# EAGLE design ballspeed (EAGLE 9.6.1)
REVISION: v1.0; TEAM: RoboCup SSL

## Sheet 1 of 3: 5V Regulator
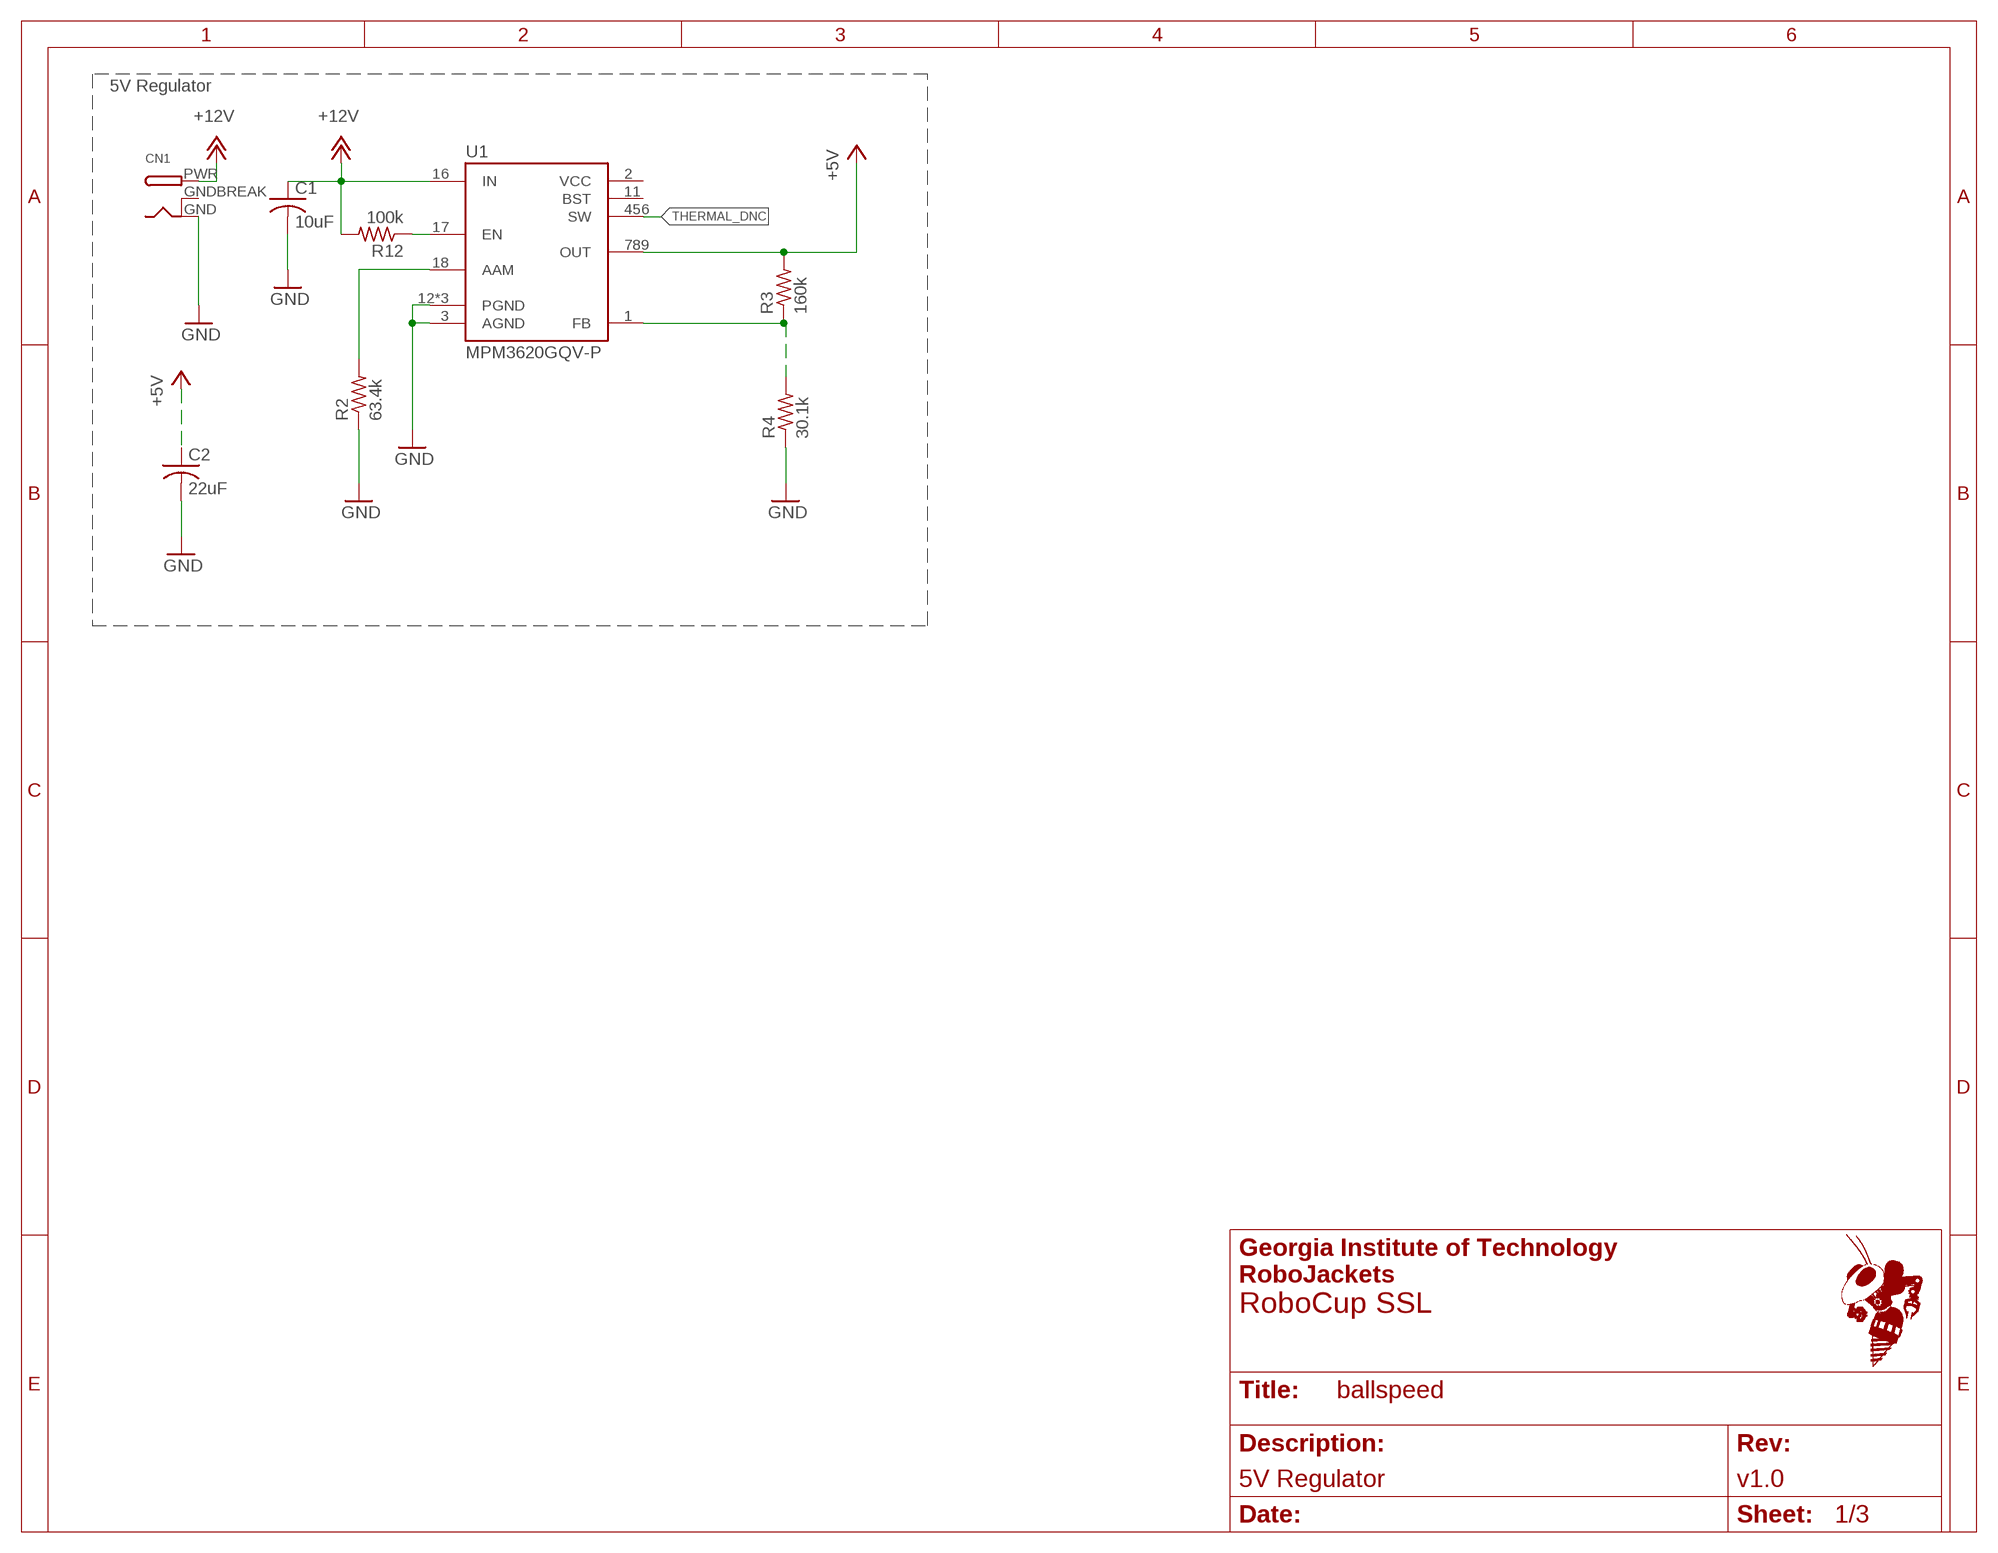
[diagram p0: schematic, sheet 1]
FRAME3 (FRAME_A_L): REVISION: v1.0; SCH_DESC: 5V Regulator; TEAM: RoboCup SSL

### Parts
C1  10uF  C-USC0603  [C0603]
C2  22uF  C-USC0603  [C0603]
CN1  DCBARRELPTH  [DCJACK_2MM_PTH]
R2  63.4k  R0603W  [R0603W]
R3  160k  R0603W  [R0603W]
R4  30.1k  R0603W  [R0603W]
R12  100k  R0603W  [R0603W]
U1  MPM3620GQV-P  [MPM3620GQV-P]

### Nets
+5V: C2.1 R3.2(PIN2) U1.789(OUT) ; also sheet 3
+12V: C1.1 CN1.PWR R12.2(PIN2) U1.16(IN)
GND: C1.2 C2.2 CN1.GND R2.1(PIN1) R4.1(PIN1) U1.3(AGND) U1.12(PGND) U1.13(PGND) U1.14(PGND) ; also sheet 2,3
N$1: R3.1(PIN1) R4.2(PIN2) U1.1(FB)
N$3: R2.2(PIN2) U1.18(AAM)
N$7: R12.1(PIN1) U1.17(EN)
THERMAL_DNC: U1.456(SW)
Unconnected: U1.2(VCC) U1.11(BST)

### Notes on the sheet
- 5V Regulator

## Sheet 2 of 3: ADC
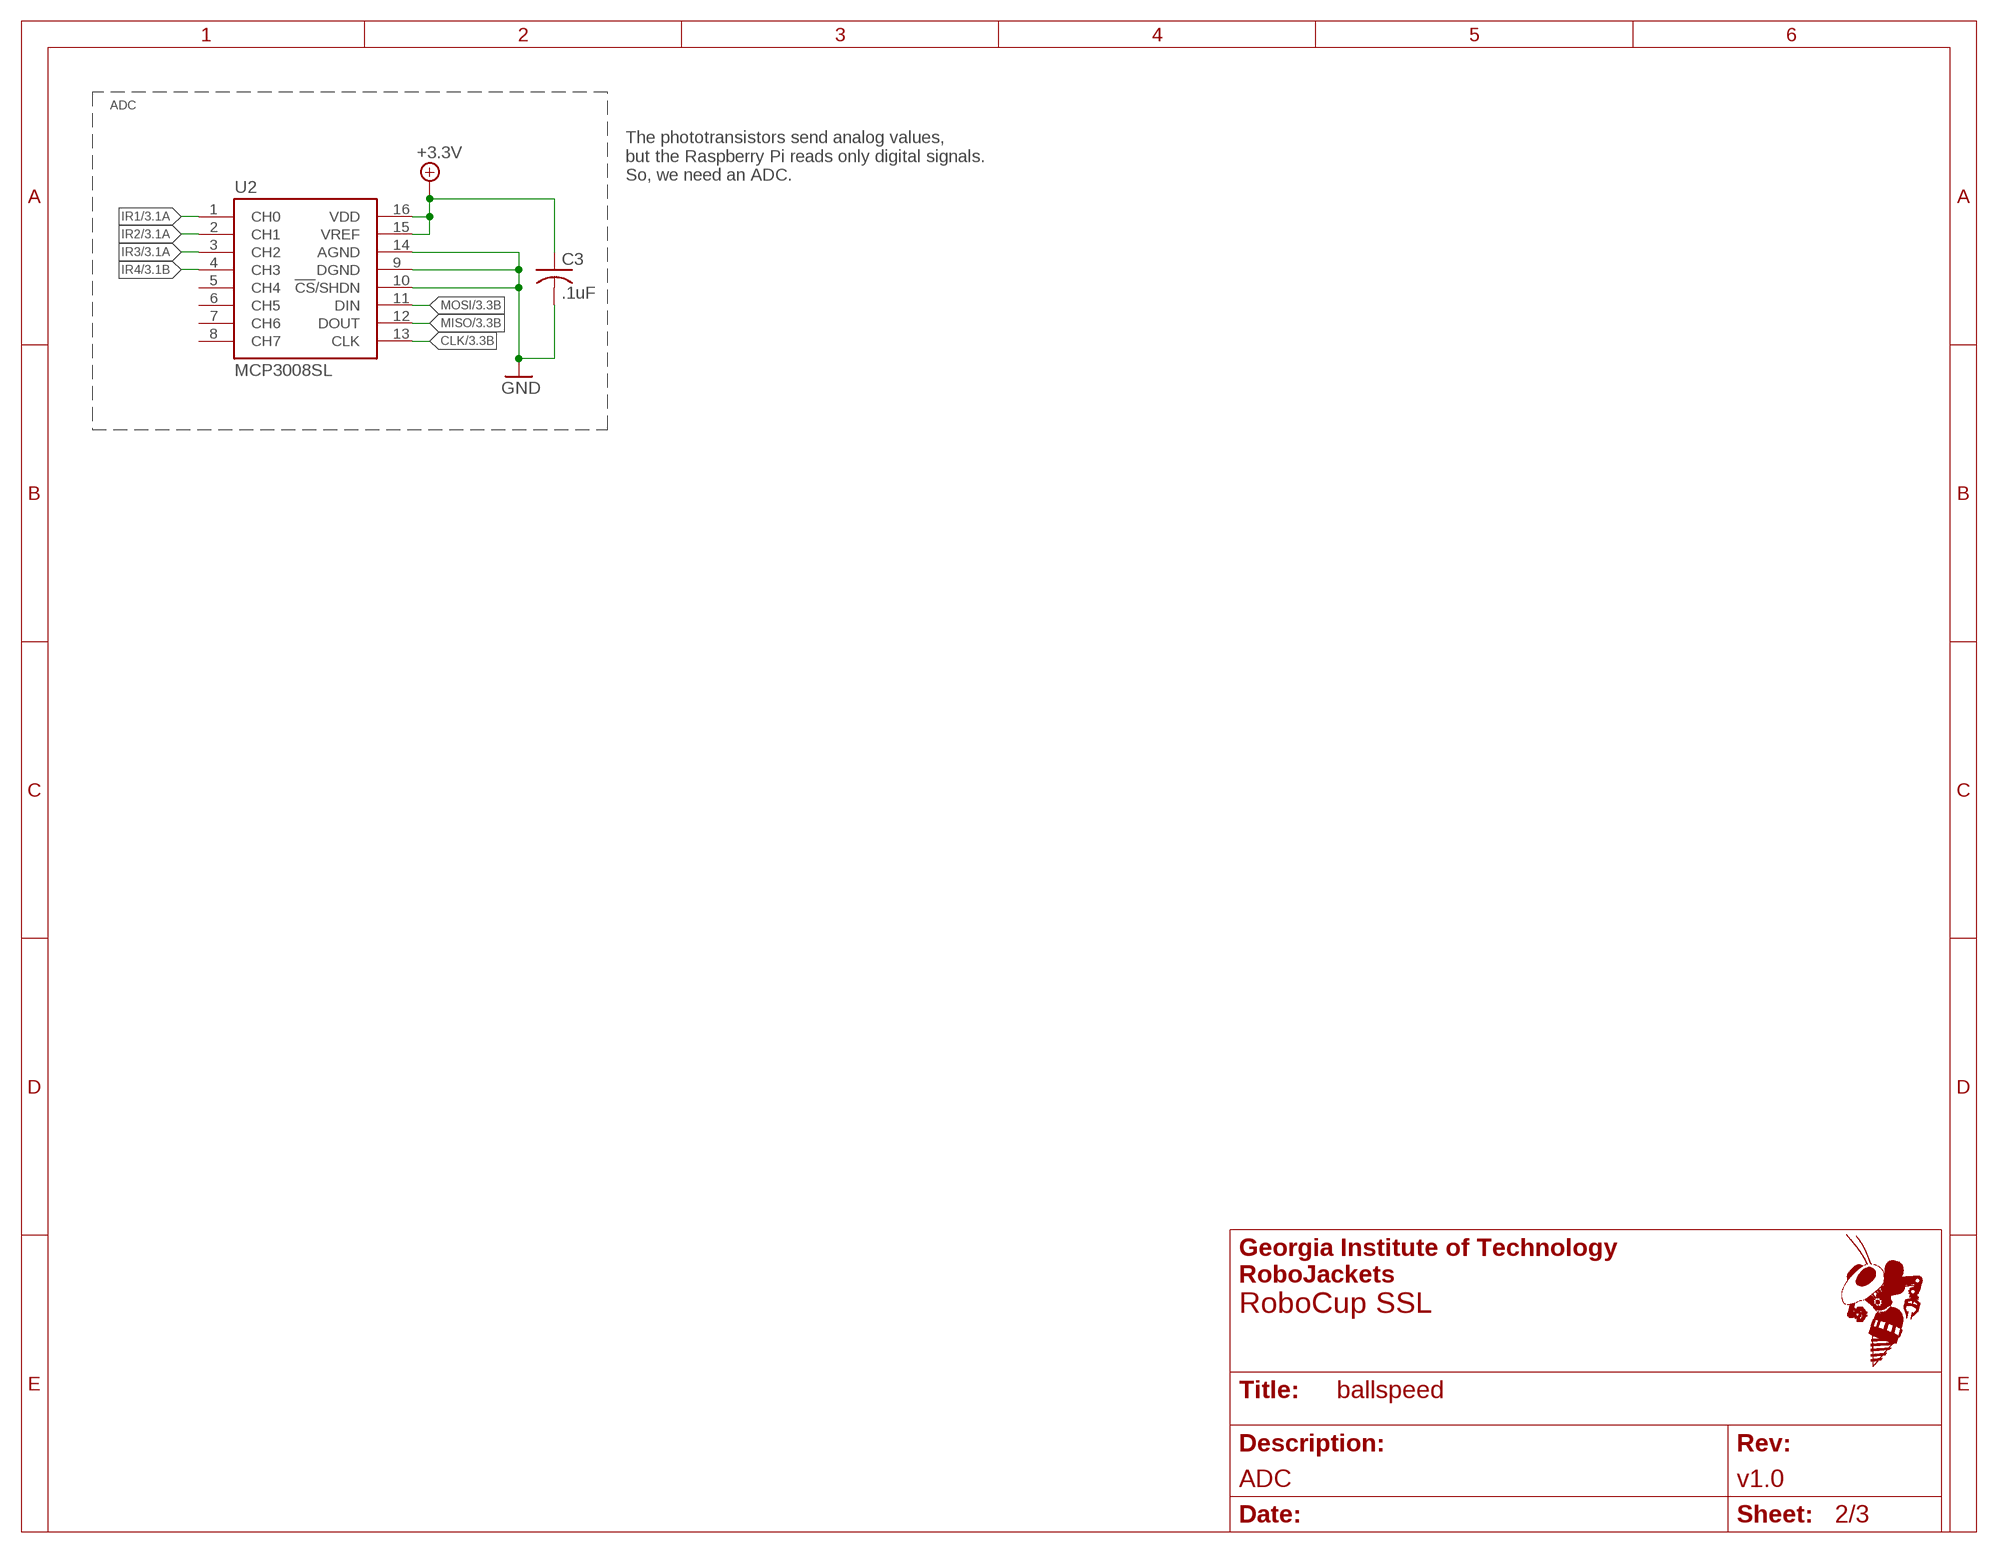
[diagram p1: schematic, sheet 2]
FRAME2 (FRAME_A_L): REVISION: v1.0; SCH_DESC: ADC; TEAM: RoboCup SSL

### Parts
C3  .1uF  C-USC0603  [C0603]
U2  MCP3008SL  [SOIC-16]

### Nets
+3.3V: C3.1 U2.15(VREF) U2.16(VDD) ; also sheet 3
CLK: U2.13(CLK) ; also sheet 3
GND: C3.2 U2.9(DGND) U2.10(!CS!/SHDN) U2.14(AGND) ; also sheet 1,3
IR1: U2.1(CH0) ; also sheet 3
IR2: U2.2(CH1) ; also sheet 3
IR3: U2.3(CH2) ; also sheet 3
IR4: U2.4(CH3) ; also sheet 3
MISO: U2.12(DOUT) ; also sheet 3
MOSI: U2.11(DIN) ; also sheet 3
Unconnected: U2.5(CH4) U2.6(CH5) U2.7(CH6) U2.8(CH7)

### Notes on the sheet
- ADC
- The phototransistors send analog values,
  but the Raspberry Pi reads only digital signals.
  So, we need an ADC.

## Sheet 3 of 3: Connectors
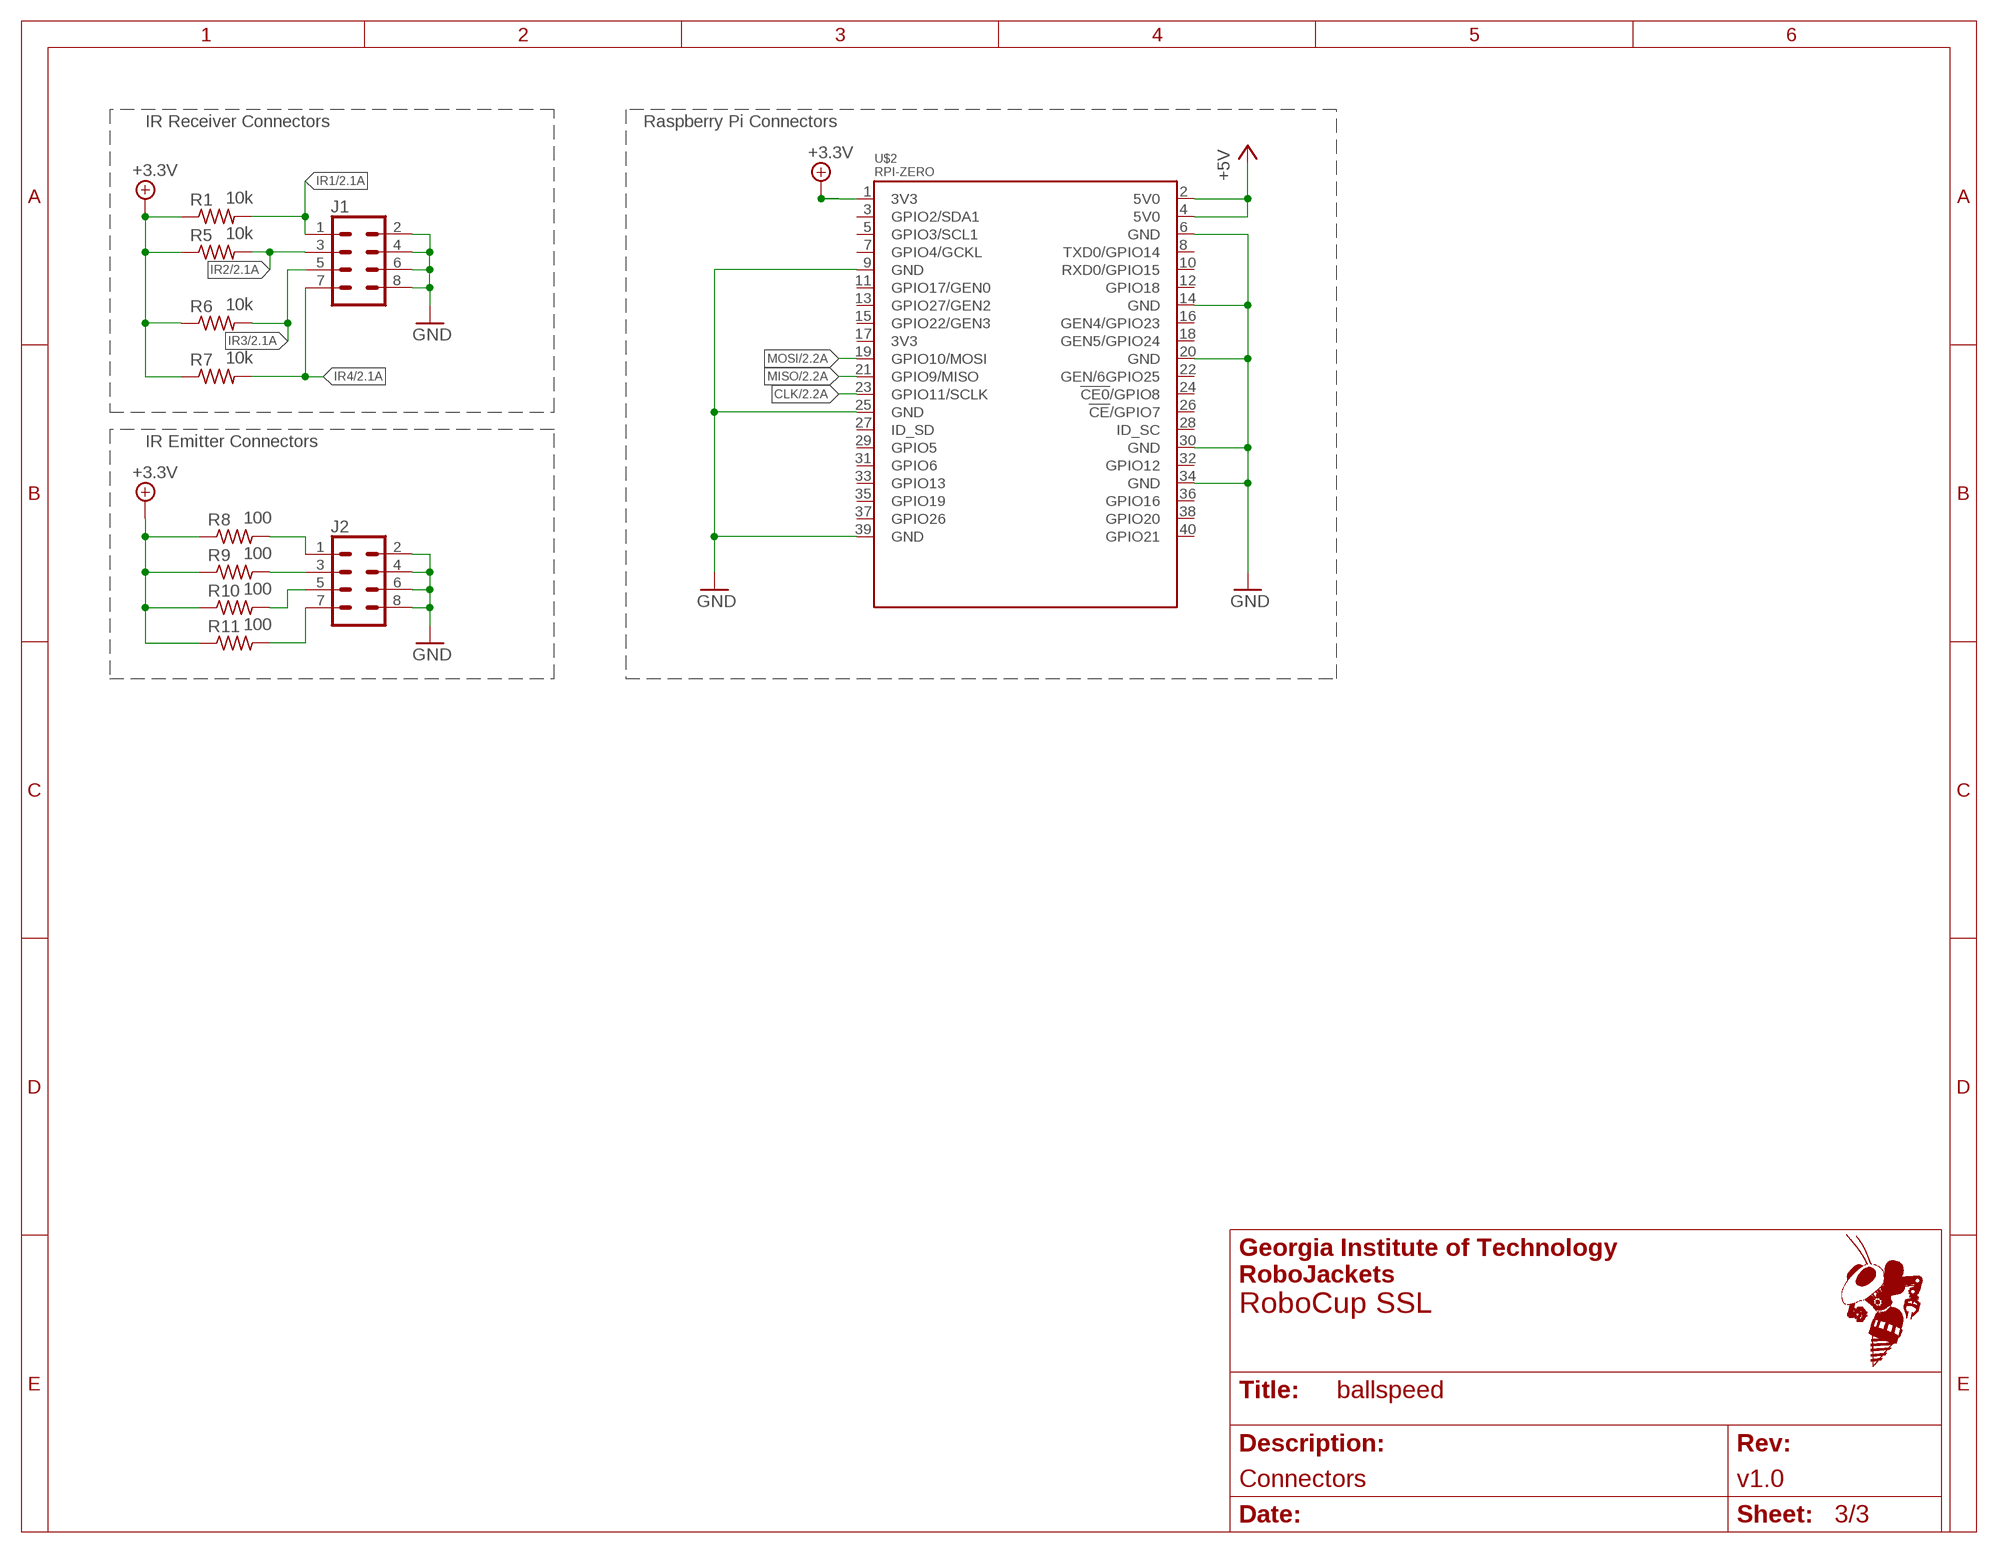
[diagram p2: schematic, sheet 3]
FRAME1 (FRAME_A_L): REVISION: v1.0; SCH_DESC: Connectors; TEAM: RoboCup SSL

### Parts
J1  CONN_04X2  [2X4]
J2  CONN_04X2  [2X4]
R1  10k  R0603W  [R0603W]
R5  10k  R0603W  [R0603W]
R6  10k  R0603W  [R0603W]
R7  10k  R0603W  [R0603W]
R8  100  R0603W  [R0603W]
R9  100  R0603W  [R0603W]
R10  100  R0603W  [R0603W]
R11  100  R0603W  [R0603W]
U$2  RPI-ZERO  [RASPBERRYPI_BASTELSTUBE_V13_RASPI_BOARD_B+_FULL]

### Nets
+3.3V: R1.1(PIN1) R5.1(PIN1) R6.1(PIN1) R7.1(PIN1) R8.1(PIN1) R9.1(PIN1) R10.1(PIN1) R11.1(PIN1) U$2.1(3V3) ; also sheet 2
+5V: U$2.2(5V0) U$2.4(5V0) ; also sheet 1
CLK: U$2.23(GPIO11/SCLK) ; also sheet 2
GND: J1.2 J1.4 J1.6 J1.8 J2.2 J2.4 J2.6 J2.8 U$2.6(GND) U$2.9(GND) U$2.14(GND) U$2.20(GND) U$2.25(GND) U$2.30(GND) U$2.34(GND) U$2.39(GND) ; also sheet 1,2
IR1: J1.1 R1.2(PIN2) ; also sheet 2
IR1-3.3V: J2.1 R8.2(PIN2)
IR2: J1.3 R5.2(PIN2) ; also sheet 2
IR2-3.3V: J2.3 R9.2(PIN2)
IR3: J1.5 R6.2(PIN2) ; also sheet 2
IR3-3.3V: J2.5 R10.2(PIN2)
IR4: J1.7 R7.2(PIN2) ; also sheet 2
IR4-3.3V: J2.7 R11.2(PIN2)
MISO: U$2.21(GPIO9/MISO) ; also sheet 2
MOSI: U$2.19(GPIO10/MOSI) ; also sheet 2
Unconnected: U$2.3(GPIO2/SDA1) U$2.5(GPIO3/SCL1) U$2.7(GPIO4/GCKL) U$2.8(TXD0/GPIO14) U$2.10(RXD0/GPIO15) U$2.11(GPIO17/GEN0) U$2.12(GPIO18) U$2.13(GPIO27/GEN2) U$2.15(GPIO22/GEN3) U$2.16(GEN4/GPIO23) U$2.17(3V3) U$2.18(GEN5/GPIO24) U$2.22(GEN/6GPIO25) U$2.24(!CE0!/GPIO8) U$2.26(!CE!/GPIO7) U$2.27(ID_SD) U$2.28(ID_SC) U$2.29(GPIO5) U$2.31(GPIO6) U$2.32(GPIO12) U$2.33(GPIO13) U$2.35(GPIO19) U$2.36(GPIO16) U$2.37(GPIO26) U$2.38(GPIO20) U$2.40(GPIO21)

### Notes on the sheet
- IR Receiver Connectors | Raspberry Pi Connectors
- IR Emitter Connectors

## Power pins joined to a net without a drawn wire
GNDBREAK: CN1.GNDBREAK

## Library data of the parts
C1-C3 = rcl:C-US: CAPACITOR, American symbol; SPICEPREFIX: C
CN1 = adafruit:DCBARREL: 2.0mm DC Barrel Jack DCJACK_2MM_PTH - Through Hole Jack (4UConnector: 05537)
J1 J2 = SparkFun-Connectors:CONN_04X2: Multi connection point. Often used as Generic Header-pin footprint for 0.1 inch spaced/style header connections On any of the 0.1 inch spaced packages, you can populate with these: Break Away Headers - Straight <https://www.sparkfun.com/products/116> (PRT-00116) Break Away Male Headers - Right Angle <https://www.sparkfun.com/products/553> (PRT-00553) Female Headers <https://www.sparkfun.com/products/115> (PRT-00115) Break Away Headers - Machine Pin <https://www.sparkfun.com/products/117> (PRT-00117) Break Away Female Headers - Swiss Machine Pin <https://www.sparkfun.com/products/743> (PRT-00743)
R1-R12 = RoboJackets-Resistors:R0603W
U1 = RoboJackets-PowerICs:MPM3620GQV-P
U2 = RoboJackets-ICs:MCP3008
U$2 = RPI-Zero:RPI-ZERO

## Board
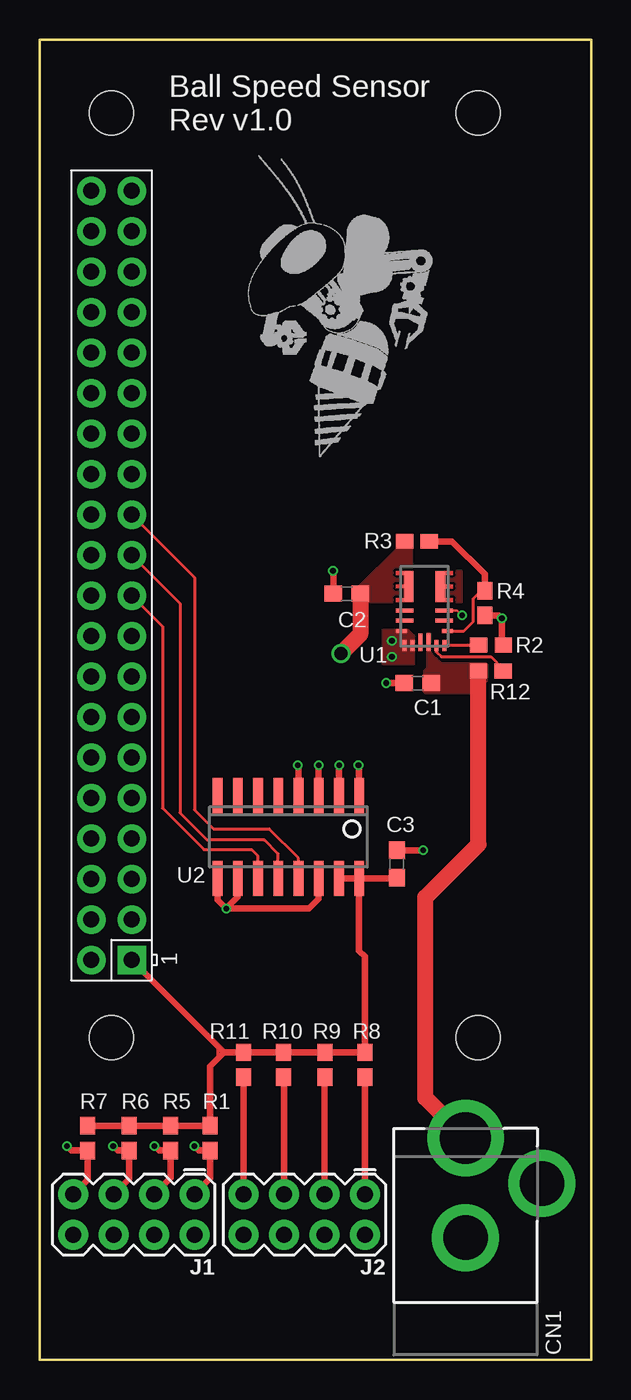
[diagram p3: board, top side]
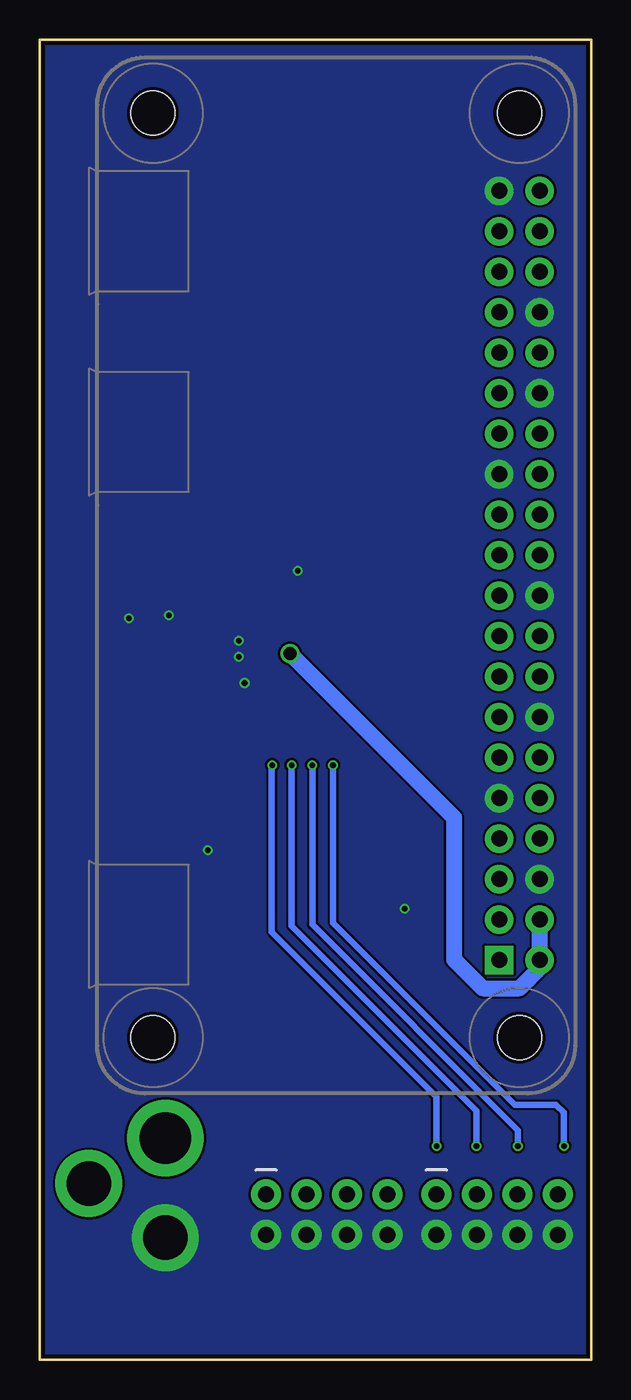
[diagram p4: board, bottom side, seen from below]

Size 34.6 x 82.8 mm. Coordinates in mm from the lower left corner, seen from the top.
Outline: 0,82.8 0,0 34.6,0 34.6,82.8 0,82.8
Copper layers (1*16): Top 0.018mm / dielectric 1.55mm / Bottom 0.018mm
Design rules "eC_2Layer_PClass6_BaseCopperO18_eCDefault": minimum track width 0.15mm, minimum drill 0.35mm, track to track 0.15mm, track to pad 0.15mm, pad to pad 0.15mm, via to via 0.15mm, smd to smd 0mil, copper to edge 0.25mm, drill to drill 0.35mm, minimum pad ring 0.175mm, minimum via ring 0.125mm, stop-mask expansion 0mil, vias tented up to drill 0.45mm, thermal gap 0.2mm

### Footprints (pad centres in the part's own frame; a part is rotated, then mirrored left to right if it is on the bottom)
C0603 = smd 1.1 x 1: 1 -0.85,0; 2 0.85,0
DCJACK_2MM_PTH = drill 2.8: GND 0,7.35; GNDBREAK 4.8,10.75 | drill 3.2: PWR 0,13.6
2X4 = drill 1.016 pad 1.88: 1 -3.81,-1.27; 2 -3.81,1.27; 3 -1.27,-1.27; 4 -1.27,1.27; 5 1.27,-1.27; 6 1.27,1.27; 7 3.81,-1.27; 8 3.81,1.27
R0603W = smd 1.09 x 0.94: 1 -0.775,0; 2 0.775,0
MPM3620GQV-P = smd 0.7 x 0.25: 1 -1.45,1.55; 12 1.45,1.55 | smd 1.1 x 0.25: 2 -1.25,0.9; 3 -1.25,0.25; 10 1.25,0.25; 11 1.25,0.9 | smd 0.25 x 0.7: 13 1.25,2.45; 14 0.75,2.45; 17 -0.75,2.45; 18 -1.25,2.45 | smd 0.25 x 1.1: 15 0.25,2.25; 16 -0.25,2.25 | smd 0.6 x 1.95: 456 -1,-1.25; 789 1,-1.25
SOIC-16 = smd 0.6 x 2.2: 1 -4.445,-2.6; 2 -3.175,-2.6; 3 -1.905,-2.6; 4 -0.635,-2.6; 5 0.635,-2.6; 6 1.905,-2.6; 7 3.175,-2.6; 8 4.445,-2.6; 9 4.445,2.6; 10 3.175,2.6; 11 1.905,2.6; 12 0.635,2.6; 13 -0.635,2.6; 14 -1.905,2.6; 15 -3.175,2.6; 16 -4.445,2.6
RASPBERRYPI_BASTELSTUBE_V13_RASPI_BOARD_B+_FULL = drill 1 pad 1.778 square: 1 8.37,25.23 | drill 1 pad 1.778: 2 8.37,27.77; 3 10.91,25.23; 4 10.91,27.77; 5 13.45,25.23; 6 13.45,27.77; 7 15.99,25.23; 8 15.99,27.77; 9 18.53,25.23; 10 18.53,27.77; 11 21.07,25.23; 12 21.07,27.77; 13 23.61,25.23; 14 23.61,27.77; 15 26.15,25.23; 16 26.15,27.77; 17 28.69,25.23; 18 28.69,27.77; 19 31.23,25.23; 20 31.23,27.77; 21 33.77,25.23; 22 33.77,27.77; 23 36.31,25.23; 24 36.31,27.77; 25 38.85,25.23; 26 38.85,27.77; 27 41.39,25.23; 28 41.39,27.77; 29 43.93,25.23; 30 43.93,27.77; 31 46.47,25.23; 32 46.47,27.77; 33 49.01,25.23; 34 49.01,27.77; 35 51.55,25.23; 36 51.55,27.77; 37 54.09,25.23; 38 54.09,27.77; 39 56.63,25.23; 40 56.63,27.77 | hole 2.75: 3.5,3.5; 3.5,26.5; 61.5,3.5; 61.5,26.5

### Placement (x,y rotation side)
C1  23.72,42.45 180 top
C2  19.27,48.05 180 top
C3  22.4,31.1 90 top
CN1  26.72,0.3 0 top
J1  5.9,9.1 180 top
J2  16.6,9.1 180 top
R1  10.7,13.9 270 top
R2  28.32,44.83 180 top
R3  23.67,51.34 180 top
R4  27.92,47.47 90 top
R5  8.2,13.9 270 top
R6  5.6,13.9 270 top
R7  3,13.9 270 top
R8  20.4,18.5 270 top
R9  17.9,18.5 270 top
R10  15.3,18.5 270 top
R11  12.8,18.5 270 top
R12  28.3,43.2 180 top
U1  24.14,47.26 180 top
U2  15.6,32.8 180 top
U$1  [ROBOBUZZ_1.0X]  17.5,56.6 0 top
U$2  31,16.7 90 top

### Tracks (layer width: path | path; a pad name or v marks a point on that pad's centre or on a via)
+3.3V
  Top 0.152: 11.2,19.5 11.27,19.57
  Top 0.2: 11.2,18.9 11.2,19.5
  Top 0.4: 11.57,19.27 11.27,19.57 U$2.1 | 11.57,19.27 R11.1 R10.1 R9.1 R8.1 20.4,25.3 20.05,25.65 U2.16 | R7.1 R6.1 R5.1 R1.1 10.7,18.41 11.2,18.9 11.57,19.27 | U2.16 U2.15 | C3.1 22.35,30.2 U2.16
+5V  (via drill 0.8)
  Top 1: C2.1 20.12,45.52 v18.9,44.3
  Bottom 1: v18.9,44.3 8.6,34 8.6,25.1 6.8,23.3 4.5,23.3 3.23,24.57 U$2.2 U$2.4
  pour Top (no thermals): 23.4,47.5 23.4,51.8 22.4,51.8 22.4,50.9 20,48.5 19.6,48.5 19.6,47.6 19.7,47.5
+12V
  Top 1: CN1.PWR 24.2,16.42 24.2,29 27.53,32.33 R12.2
  pour Top (no thermals): 24.3,45.6 24.3,43.4 24.1,43.2 24.1,41.9 24.2,41.8 27.3,41.8 28.1,42.6 28.1,43.6 28,43.7 25.2,43.7 24.5,44.4 24.5,45.6
CLK
  Top 0.2: U2.13 16.23,31.46 14.4,33.3 10.9,33.3 9.7,34.5 9.7,49.08 U$2.23
GND  (via drill 0.35)
  Top 0.152: U1.3 26.19,47.01 v26.5,46.7
  Top 0.4: U2.9 11.16,28.84 v11.7,28.3 | U2.10 12.43,29.02 v11.7,28.3 | U2.14 17.5,28.9 16.9,28.3 v11.7,28.3 | C3.2 v24.05,31.95 | C2.2 18.42,49.48 v18.4,49.5 | R4.1 28.8,46.7 v29,46.5 29,44.93 R2.1 | C1.2 v21.75,42.45
  other vias: 22.1,44.1 22.1,45.1
  pour Bottom (no thermals): 0,82.8 34.6,82.8 34.6,0 0,0
  pour Top (no thermals): 21.5,45.8 23.1,45.8 23.5,45.4 23.5,43.6 21.5,43.6
  pour Bottom: -0.7,83.5 35.1,83.5 35.1,-0.7 -0.7,-0.7
IR1  (via drill 0.35)
  Top 0.4: J1.1 10.7,11.36 R1.2 9.98,13.12 v9.7,13.4 | v20,37.3 20.05,37.35 U2.1
  Bottom 0.4: v9.7,13.4 9.7,16.5 20.05,26.85 20.05,37.25 v20,37.3
IR1-3.3V
  Top 0.4: J2.1 20.41,17.71 R8.2
IR2  (via drill 0.35)
  Top 0.4: J1.3 8.2,11.4 R5.2 7.47,13.12 v7.2,13.4 | U2.2 18.78,37.28 v18.8,37.3
  Bottom 0.4: v7.2,13.4 7.2,15.6 18.8,27.2 v18.8,37.3
IR2-3.3V
  Top 0.4: J2.3 17.87,17.7 R9.2
IR3  (via drill 0.35)
  Top 0.4: J1.5 5.6,11.34 R6.2 4.88,13.12 v4.6,13.4 | v17.5,37.3 U2.3
  Bottom 0.4: v4.6,13.4 4.6,14.4 17.5,27.3 v17.5,37.3
IR3-3.3V
  Top 0.4: J2.5 15.33,17.7 R10.2
IR4  (via drill 0.35)
  Top 0.4: J1.7 3,11.28 R7.2 1.98,13.12 v1.7,13.4 | v16.2,37.3 16.23,37.34 U2.4
  Bottom 0.4: v1.7,13.4 1.7,15.5 2.2,16 4.8,16 16.2,27.4 v16.2,37.3
IR4-3.3V
  Top 0.4: J2.7 12.79,17.71 R11.2
MISO
  Top 0.2: U2.12 14.96,31.73 14.1,32.6 10.5,32.6 8.8,34.3 8.8,47.44 U$2.21
MOSI
  Top 0.2: U2.11 13.7,31.61 13.3,32 10.3,32 7.7,34.6 7.7,46 U$2.19
N$1
  Top 0.2: U1.1 26.61,45.71 27.2,46.3 27.2,47.75 27.7,48.25 R4.2
  Top 0.4: R3.1 25.86,51.34 27.92,49.28 R4.2
N$3
  Top 0.2: R2.2 27.53,44.81 U1.18
N$7
  Top 0.2: U1.17 24.89,44.41 25.2,44.1 28.3,44.1 29.07,43.33 R12.1
THERMAL_DNC
  pour Top (no thermals): 24.8,49.5 24.8,47.5 26.5,47.5 26.5,49.5

### Text on the board
tPlace: Ball Speed Sensor / Rev